# Altium schematic sheet Top Sheet.SchDoc
size A; DocumentNumber: 1; SheetNumber: 1; SheetTotal: 3
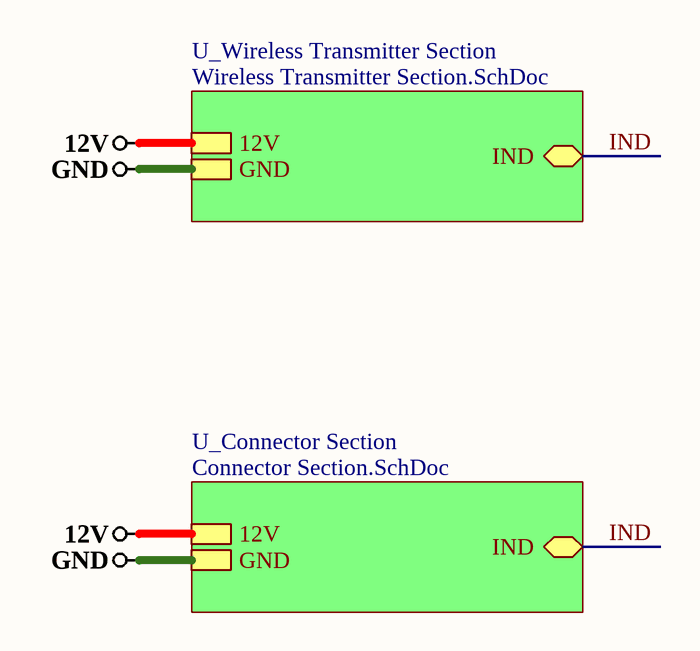
[diagram p0: Top Sheet.SchDoc]

## Sub-sheets
U_Connector Section = Connector Section.SchDoc: IND (bidir), 12V, GND
U_Wireless Transmitter Section = Wireless Transmitter Section.SchDoc: IND (bidir), 12V, GND

## Nets
12V: sheet U_Wireless Transmitter Section/12V, sheet U_Connector Section/12V
GND: sheet U_Wireless Transmitter Section/GND, sheet U_Connector Section/GND
IND: sheet U_Wireless Transmitter Section/IND, sheet U_Connector Section/IND